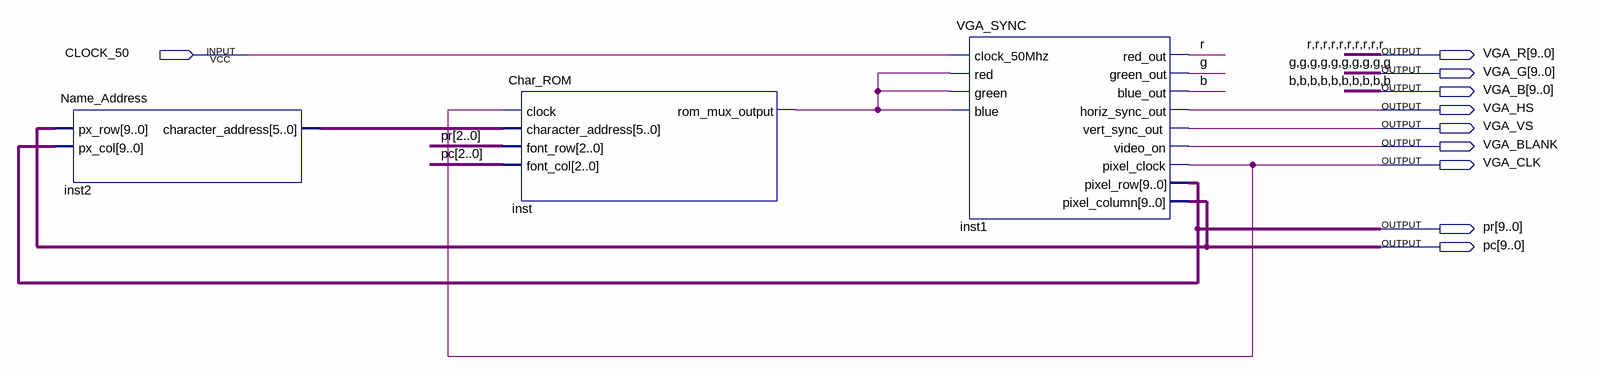
[diagram p0: schematic sheet]
// Quartus schematic CHAR_ROM_TEST.bdf as structural Verilog: 3 symbols, 10 pins
module CHAR_ROM_TEST (
  input  CLOCK_50,
  output [9:0] VGA_R,
  output [9:0] VGA_G,
  output [9:0] VGA_B,
  output VGA_HS,
  output VGA_VS,
  output VGA_BLANK,
  output VGA_CLK,
  output [9:0] pr,
  output [9:0] pc
);

  wire inst_rom_mux_output;
  wire [5:0] inst2_character_address;

  Name_Address inst2 (.px_row(pc), .px_col(pr), .character_address(inst2_character_address));
  Char_ROM inst (
    .clock(VGA_CLK), .character_address(inst2_character_address), .font_row(pr[2:0]), .font_col(pc[2:0]),
    .rom_mux_output(inst_rom_mux_output));
  VGA_SYNC inst1 (
    .clock_50Mhz(CLOCK_50), .red(inst_rom_mux_output), .green(inst_rom_mux_output),
    .blue(inst_rom_mux_output), .red_out(VGA_R[9]), .green_out(VGA_G[9]), .blue_out(VGA_B[9]),
    .horiz_sync_out(VGA_HS), .vert_sync_out(VGA_VS), .video_on(VGA_BLANK), .pixel_clock(VGA_CLK),
    .pixel_row(pr), .pixel_column(pc));

  assign VGA_B[8:0] = {9{VGA_B[9]}};
  assign VGA_G[8:0] = {9{VGA_G[9]}};
  assign VGA_R[8:0] = {9{VGA_R[9]}};

  // Other names for the same wires on the sheet: b = VGA_B[9]; g = VGA_G[9]; r = VGA_R[9]
endmodule
